# Altium schematic sheet Power_Sheet.SchDoc
size A; DocumentNumber: 2; SheetNumber: 2; SheetTotal: 7
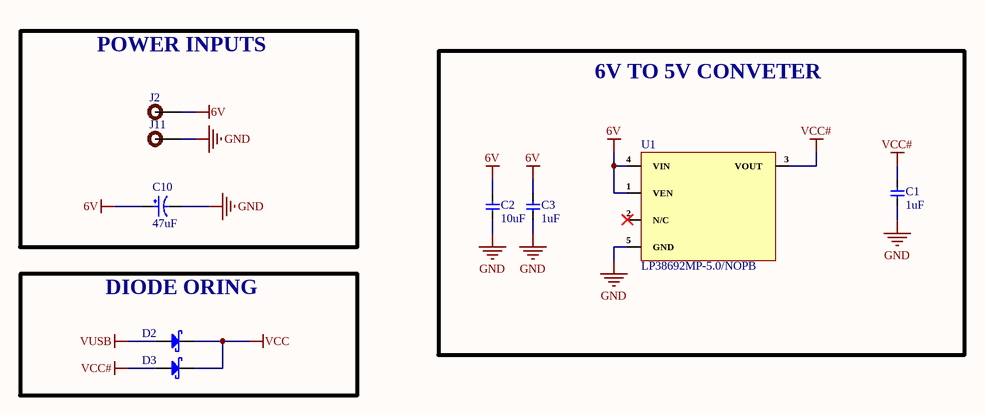
[diagram p0: Power_Sheet.SchDoc]

## Parts
C1  1uF  [Cap-0402]
C2  10uF  [Cap-0402]
C3  1uF  [Cap-0402]
C10  47uF  [Case-D]
D2  SS54B-HF  [SMB_]  (value not drawn)
D3  SS54B-HF  [SMB_]  (value not drawn)
J2  Test Point -TH 1.8mm Hole size 0.92mm  [Test Point -TH 1.8mm Hole size 0.92mm]  (value not drawn)  (no BOM)
J11  Test Point -TH 1.8mm Hole size 0.92mm  [Test Point -TH 1.8mm Hole size 0.92mm]  (value not drawn)  (no BOM)
U1  LP38692MP-5.0/NOPB  [SOT-223-5]

## Blocks framed on the sheet
POWER INPUTS: C10 J2 J11
6V TO 5V CONVETER: C1-C3 U1
DIODE ORING: D2 D3

## Nets
6V: C2.2 C3.2 C10.1 J2.1 U1.1(VEN) U1.4(VIN)
GND: C1.1 C2.1 C3.1 C10.2 J11.1 U1.5(GND)
VCC: D2.2(K) D3.2(K)
VCC#: C1.2 D3.1(A) U1.3(VOUT)
VUSB: D2.1(A)

Not connected (* = marked no-connect by the designer): U1 2(N/C)*

## Library data of the parts
C1 C3 = CC0402KRX5R6BB105: CAP CER 1UF 10V X5R 0402; Manufacturer: Yageo; Tolerance: 10%; Dissipation Factor: 15%; Item Type: Capacitor; Supplier 1: Mouser; Manufacturer Part Number: CC0402KRX5R6BB105; RoHS: Yes; Category: Ceramic Capacitors; Stock 1: 6711367; Pricing 1: 1=0.11000, 10=0.05500, 50=0.05500, 100=0.03300, 500=0.02700, 1000=0.02200, 2500=0.02100, 10000=0.01800 (USD); Mount: Surface Mount; Case/Package: 0402; Number of Pins: 2; Case Code (Metric): 1005; Case Code (Imperial): 0402; Min Operating Temperature: -55°C; Max Operating Temperature: 85°C; Capacitance: 1uF; Dielectric: X5R; Package Quantity: 1; Voltage Rating: 10V; Packaging: Tape and Reel; Voltage Rating (DC): 10V; Termination: SMD/SMT; Resistor Type: Ceramic; Series: CC; Construction: Flat; Length: 1mm; Width: 0.02inch; Height: 0.5mm; Thickness: 0.022inch; Depth: 0.5mm; Radiation Hardening: No; REACH SVHC: No SVHC; Lead Free: Lead Free; Halogen Free: Halogen Free; RoHS Compliant: Yes; ComponentLink1URL: https://datasheet.ciiva.com/176/upy-gphc-x5r-4v-to-50v-12-176704.pdf?src-supplier=Digi-Key; ComponentLink1Description: https://datasheet.ciiva.com/176/upy-gphc-x5r-4v-to-50v-12-176704.pdf?src-supplier=Digi-Key; ComponentLink2URL: https://datasheet.ciiva.com/176/mlccorderingcode-176705.pdf?src-supplier=Digi-Key; ComponentLink2Description: https://datasheet.ciiva.com/176/mlccorderingcode-176705.pdf?src-supplier=Digi-Key; ComponentLink3URL: https://datasheet.ciiva.com/176/mlccorderingcode-176706.pdf?src-supplier=Digi-Key; ComponentLink3Description: https://datasheet.ciiva.com/176/mlccorderingcode-176706.pdf?src-supplier=Digi-Key; Supplier Part Number 1: 603-CC402KRX5R6BB105; LCSC Part Number: C106254
C2 = CC0402MRX5R6BB106: CAP CER 10UF 10V X5R 0402; Manufacturer: Yageo; Tolerance: 20%; Item Type: Capacitor; Supplier 1: Future Electronics; Manufacturer Part Number: CC0402MRX5R6BB106; RoHS: Yes; Category: Ceramic Capacitors; Stock 1: 80000; Pricing 1: 10000=0.02650, 20000=0.02590, 30000=0.02550, 40000=0.02530, 50000=0.02450 (USD); Mount: Surface Mount; Case/Package: 0402; Case Code (Imperial): 0402; Case Code (Metric): 1005; Min Operating Temperature: -55°C; Max Operating Temperature: 85°C; Packaging: Tape and Reel; Capacitance: 10uF; Voltage Rating: 10V; RoHS Compliant: Yes; ComponentLink1URL: http://www.yageo.com/documents/recent/UPY-GPHC_X5R_4V-to-50V_25.pdf?src-supplier=Digi-Key; ComponentLink1Description: http://www.yageo.com/documents/recent/UPY-GPHC_X5R_4V-to-50V_25.pdf?src-supplier=Digi-Key; Supplier Part Number 1: 6097631; LCSC Part Number: C962143
C10 = CA45-D025K476T: 47uF 25V 0.9Ω@100kHz ±10% CASE-D-7343 Tantalum Capacitors ROHS; Manufacturer: Hunan Xiangyee in S&T; Manufacturer Part Number: CA45-D025K476T; ComponentLink1URL: https://www.lcsc.com/product-detail/Tantalum-Capacitors_Hunan-Xiangyee-in-S-T-CA45-D025K476T_C123267.html; ComponentLink1Description: LCSC; LCSC Part Number: C123267; Item Type: Capacitor; Package: CASE-D-7343
D2 D3 = SS54B-HF: DIODE SCHOTTKY 5A 40V SMB; Manufacturer: Comchip; Supplier 1: Mouser; Manufacturer Part Number: SS54B-HF; RoHS: No; Stock 1: 2862; Pricing 1: 1=0.56000, 10=0.32900, 50=0.32900, 100=0.17100, 1000=0.11900, 10000=0.09000 (USD); Supplier Part Number 1: 750-SS54B-HF; LCSC Part Number: C3759253
U1 = LP38692MP-5.0/NOPB: IC REG LINEAR 5V 1A SOT223-5; Manufacturer: Texas Instruments; Item Type: LDO; Supplier: Mouser; Supplier Part Number: 926-38692MP-5.0/NOPB; Manufacturer Part Number: LP38692MP-5.0/NOPB; RoHS: Yes; Stock: 1461; Pricing: 1=2.01, 10=1.71, 50=1.71, 100=1.45, 1000=0.91, 10000=0.888 (USD); Thickness: 1.6mm; ComponentLink1URL: https://datasheet.ciiva.com/6596/lp38690-6596184.pdf?src-supplier=Digikey; ComponentLink1Description: https://datasheet.ciiva.com/6596/lp38690-6596184.pdf?src-supplier=Digikey; ComponentLink2URL: https://datasheet.ciiva.com/6596/lp38690-6596185.pdf?src-supplier=Digikey; ComponentLink2Description: https://datasheet.ciiva.com/6596/lp38690-6596185.pdf?src-supplier=Digikey; ComponentLink3URL: https://datasheet.ciiva.com/6596/lp38690-6596186.pdf?src-supplier=Digikey; ComponentLink3Description: https://datasheet.ciiva.com/6596/lp38690-6596186.pdf?src-supplier=Digikey; ComponentLink4URL: https://datasheet.ciiva.com/14278/lp38692-14278796.pdf?src-supplier=Avnet; ComponentLink4Description: https://datasheet.ciiva.com/14278/lp38692-14278796.pdf?src-supplier=Avnet; ComponentLink5URL: https://datasheet.ciiva.com/22704/1854710-22704677.pdf?src-supplier=Element14; ComponentLink5Description: https://datasheet.ciiva.com/22704/1854710-22704677.pdf?src-supplier=Element14; LCSC Part Number: C28191